# Altium schematic sheet SPSU_5.SchDoc: SPSU
size 292 x 217 mm; PCB_VERSION: V3.0; Origin: Eagle; Date: 12/02/2024 2:33:38 pm; SheetNumber: 6; SCHEMATIC_VERSION: SCHEMATIC_VERSION; GateName_1: G$1; SymbolName_1: A4L-LOC; LibraryName: frames_corvus; DeviceSetName: A4L-LOC; Sheet: Sheet:
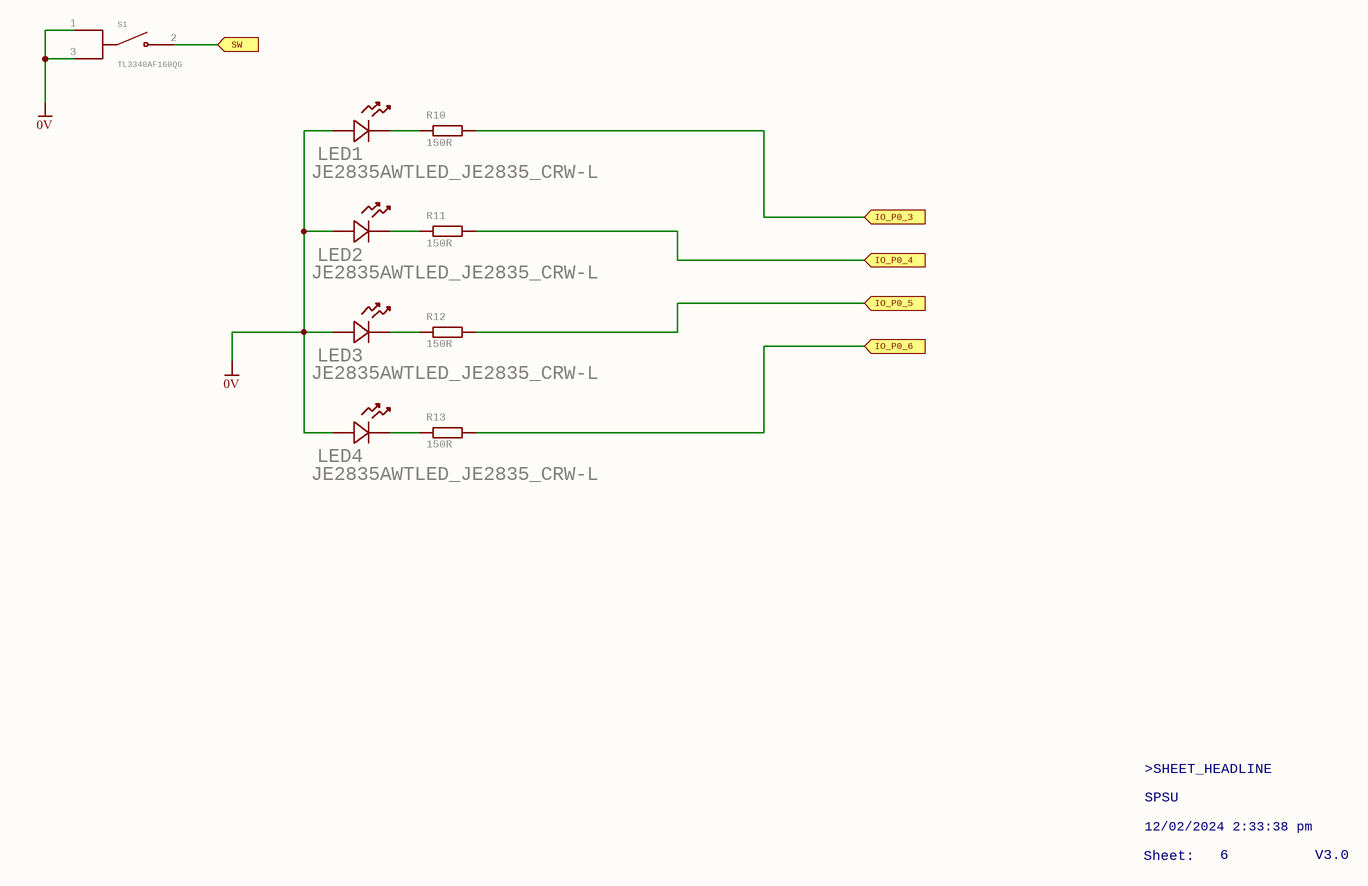
[diagram p0: SPSU_5.SchDoc]

## Parts
LED1  JE2835AWTLED_JE2835_CRW-L  [LED_JE2835_CRW-L]
LED2  JE2835AWTLED_JE2835_CRW-L  [LED_JE2835_CRW-L]
LED3  JE2835AWTLED_JE2835_CRW-L  [LED_JE2835_CRW-L]
LED4  JE2835AWTLED_JE2835_CRW-L  [LED_JE2835_CRW-L]
R10  150R  [R0603]
R11  150R  [R0603]
R12  150R  [R0603]
R13  150R  [R0603]
S1  TL3340AF160QG  [SW_TL3340AF160QG]

## Ports
IO_P0_3 (in), IO_P0_4 (in), IO_P0_5 (in), IO_P0_6 (in), SW (in)

## Nets
0V: LED1.1 LED2.1 LED3.1 LED4.1 S1.1(COM_1) S1.3(COM_2)
IO_P0_3: R10.2 ; port IO_P0_3
IO_P0_4: R11.2 ; port IO_P0_4
IO_P0_5: R12.2 ; port IO_P0_5
IO_P0_6: R13.2 ; port IO_P0_6
SW: S1.2(NO) ; port SW
NetLED1_2: LED1.2 R10.1
NetLED2_2: LED2.2 R11.1
NetLED3_2: LED3.2 R12.1
NetLED4_2: LED4.2 R13.1

## Notes on the sheet
- >SHEET_HEADLINE
- Sheet:
- SPSU
- 12/02/2024 2:33:38 pm
- 6
- V3.0

## Library data of the parts
LED1-LED4 = JE2835AWTLED_JE2835_CRW-L: MANUFACTURER_PART_NUMBER: JE2835AWT-00-0000-000A0UF830E; MFR_NAME: Wolfspeed; GateName_1: A; SymbolName_1: LED; DeviceName: LED_JE2835_CRW-L; LibraryName: HBLED; DeviceSetName: JE2835AWT; COPYRIGHT: Copyright (C) 2022 Ultra Librarian. All rights reserved.
R10-R13 = R_0603: GateName_1: >R_NAME$1; SymbolName_1: R-EU; LibraryName: corvus_RC; DeviceSetName: R_0603; FARNELL: FARNELL
S1 = TL3340AF160QG: Check availability; GateName_1: G$1; MOUSSER: 612-TL3340AF160QG; SymbolName_1: TL3340AF160QG; LibraryName: corvus_parts; DeviceSetName: TL3340AF160QG; DIGIKEY: EG4627TR-ND; FARNELL: 2787247